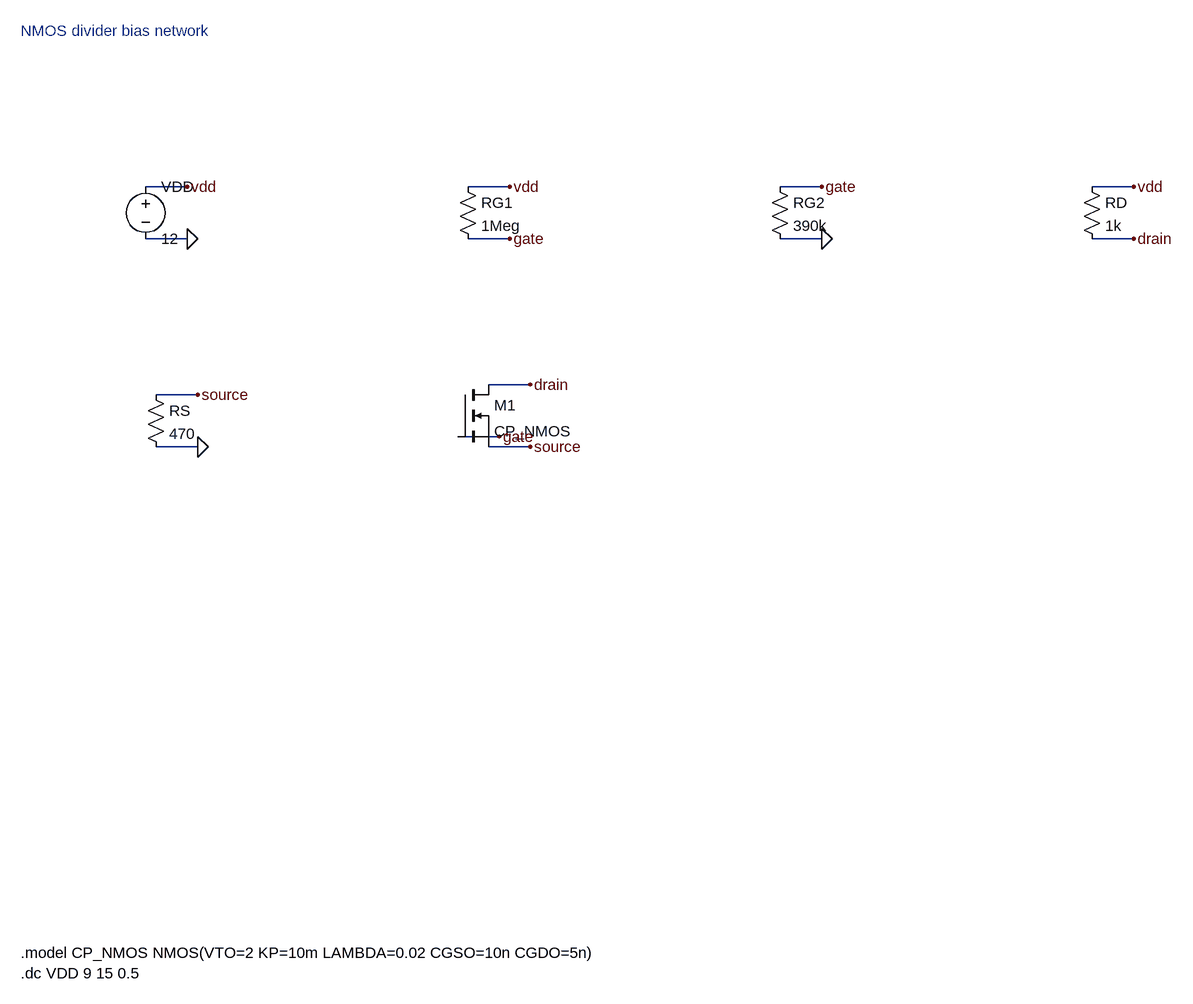
[diagram p0: schematic mosfet-bias-network.asc]
mosfet-bias-network.asc, the LTspice schematic file:
Version 4
SHEET 1 2400 2000
TEXT 64 32 Left 2 ;NMOS divider bias network
SYMBOL voltage 256 256 R0
SYMATTR InstName VDD
SYMATTR Value 12
WIRE 320 272 256 272
FLAG 320 272 vdd
WIRE 320 352 256 352
FLAG 320 352 0
SYMBOL res 736 256 R0
SYMATTR InstName RG1
SYMATTR Value 1Meg
WIRE 816 272 752 272
FLAG 816 272 vdd
WIRE 816 352 752 352
FLAG 816 352 gate
SYMBOL res 1216 256 R0
SYMATTR InstName RG2
SYMATTR Value 390k
WIRE 1296 272 1232 272
FLAG 1296 272 gate
WIRE 1296 352 1232 352
FLAG 1296 352 0
SYMBOL res 1696 256 R0
SYMATTR InstName RD
SYMATTR Value 1k
WIRE 1776 272 1712 272
FLAG 1776 272 vdd
WIRE 1776 352 1712 352
FLAG 1776 352 drain
SYMBOL res 256 576 R0
SYMATTR InstName RS
SYMATTR Value 470
WIRE 336 592 272 592
FLAG 336 592 source
WIRE 336 672 272 672
FLAG 336 672 0
SYMBOL nmos 736 576 R0
SYMATTR InstName M1
SYMATTR Value CP_NMOS
SYMATTR SpiceLine W=10u L=1u
WIRE 848 576 784 576
FLAG 848 576 drain
WIRE 800 656 736 656
FLAG 800 656 gate
WIRE 848 672 784 672
FLAG 848 672 source
TEXT 64 1450 Left 2 !.model CP_NMOS NMOS(VTO=2 KP=10m LAMBDA=0.02 CGSO=10n CGDO=5n)
TEXT 64 1482 Left 2 !.dc VDD 9 15 0.5

The netlist it stands for:
* mosfet-bias-network.asc
VDD vdd 0 12
RG1 vdd gate 1Meg
RG2 gate 0 390k
RD vdd drain 1k
RS source 0 470
M1 drain gate source source CP_NMOS W=10u L=1u
.model NMOS NMOS
.model PMOS PMOS
.lib standard.mos
* NMOS divider bias network
.model CP_NMOS NMOS(VTO=2 KP=10m LAMBDA=0.02 CGSO=10n CGDO=5n)
.dc VDD 9 15 0.5
.backanno
.end